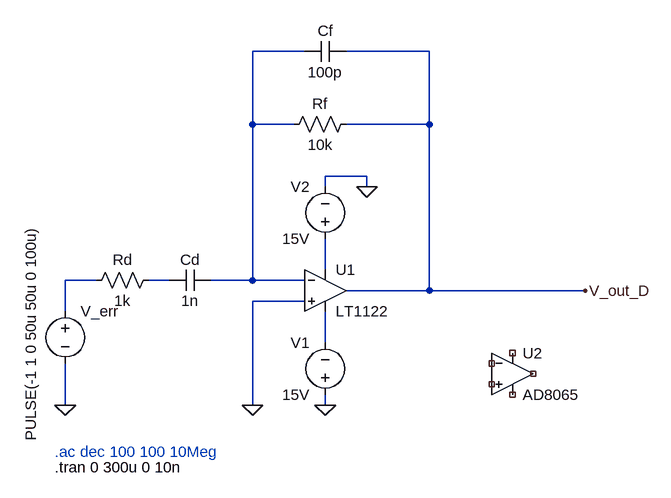
[diagram p0: schematic SIM-ANALOG-012.asc]
SIM-ANALOG-012.asc, the LTspice schematic file:
Version 4.1
SHEET 1 880 680
WIRE 176 -208 96 -208
WIRE 368 -208 240 -208
WIRE 96 -96 96 -208
WIRE 160 -96 96 -96
WIRE 368 -96 368 -208
WIRE 368 -96 240 -96
WIRE 272 -16 208 -16
WIRE 208 0 208 -16
WIRE 272 0 272 -16
WIRE 208 128 208 80
WIRE -144 144 -192 144
WIRE -32 144 -64 144
WIRE 96 144 96 -96
WIRE 96 144 32 144
WIRE 176 144 96 144
WIRE 368 160 368 -96
WIRE 368 160 240 160
WIRE 608 160 368 160
WIRE 176 176 96 176
WIRE -192 192 -192 144
WIRE 208 240 208 192
WIRE -192 336 -192 272
WIRE 96 336 96 176
WIRE 208 336 208 320
FLAG 272 0 0
FLAG 208 336 0
FLAG 608 160 V_out_D
FLAG 96 336 0
FLAG -192 336 0
SYMBOL voltage 208 336 R180
WINDOW 0 24 96 Left 2
WINDOW 3 24 16 Left 2
WINDOW 123 0 0 Left 0
WINDOW 39 0 0 Left 0
SYMATTR InstName V1
SYMATTR Value 15V
SYMBOL voltage 208 96 R180
WINDOW 0 24 96 Left 2
WINDOW 3 24 16 Left 2
WINDOW 123 0 0 Left 0
WINDOW 39 0 0 Left 0
SYMATTR InstName V2
SYMATTR Value 15V
SYMBOL res 256 -112 R90
WINDOW 0 0 56 VBottom 2
WINDOW 3 32 56 VTop 2
SYMATTR InstName Rf
SYMATTR Value 10k
SYMBOL cap 240 -224 R90
WINDOW 0 0 32 VBottom 2
WINDOW 3 32 32 VTop 2
SYMATTR InstName Cf
SYMATTR Value 100p
SYMBOL cap 32 128 R90
WINDOW 0 0 32 VBottom 2
WINDOW 3 32 32 VTop 2
SYMATTR InstName Cd
SYMATTR Value 1n
SYMBOL res -48 128 R90
WINDOW 0 0 56 VBottom 2
WINDOW 3 32 56 VTop 2
SYMATTR InstName Rd
SYMATTR Value 1k
SYMBOL voltage -192 176 R0
WINDOW 3 -53 -117 VRight 2
WINDOW 123 24 124 Left 2
WINDOW 39 0 0 Left 0
SYMATTR Value PULSE(-1 1 0 50u 50u 0 100u)
SYMATTR InstName V_err
SYMBOL OpAmps\\AD8065 496 224 R0
SYMATTR InstName U2
SYMBOL OpAmps\\LT1122 208 96 R0
SYMATTR InstName U1
TEXT -208 408 Left 2 ;.ac dec 100 100 10Meg
TEXT -208 432 Left 2 !.tran 0 300u 0 10n

The netlist it stands for:
* SIM-ANALOG-012.asc
V1 0 N005 15V
V2 N002 0 15V
Rf V_out_D N001 10k
Cf V_out_D N001 100p
Cd N001 N004 1n
Rd N004 N003 1k
V_err N003 0 PULSE(-1 1 0 50u 50u 0 100u)
X§U2 NC_01 NC_02 NC_03 NC_04 NC_05 AD8065  ; pins In+ In- V+ V- OUT
X§U1 0 N001 N002 N005 V_out_D LT1122  ; pins In+ In- V+ V- OUT
* .ac dec 100 100 10Meg
.tran 0 300u 0 10n
.backanno
.end